# Altium schematic sheet MFG01_01.SchDoc
size A1; SheetNumber: 1; SheetTotal: 1
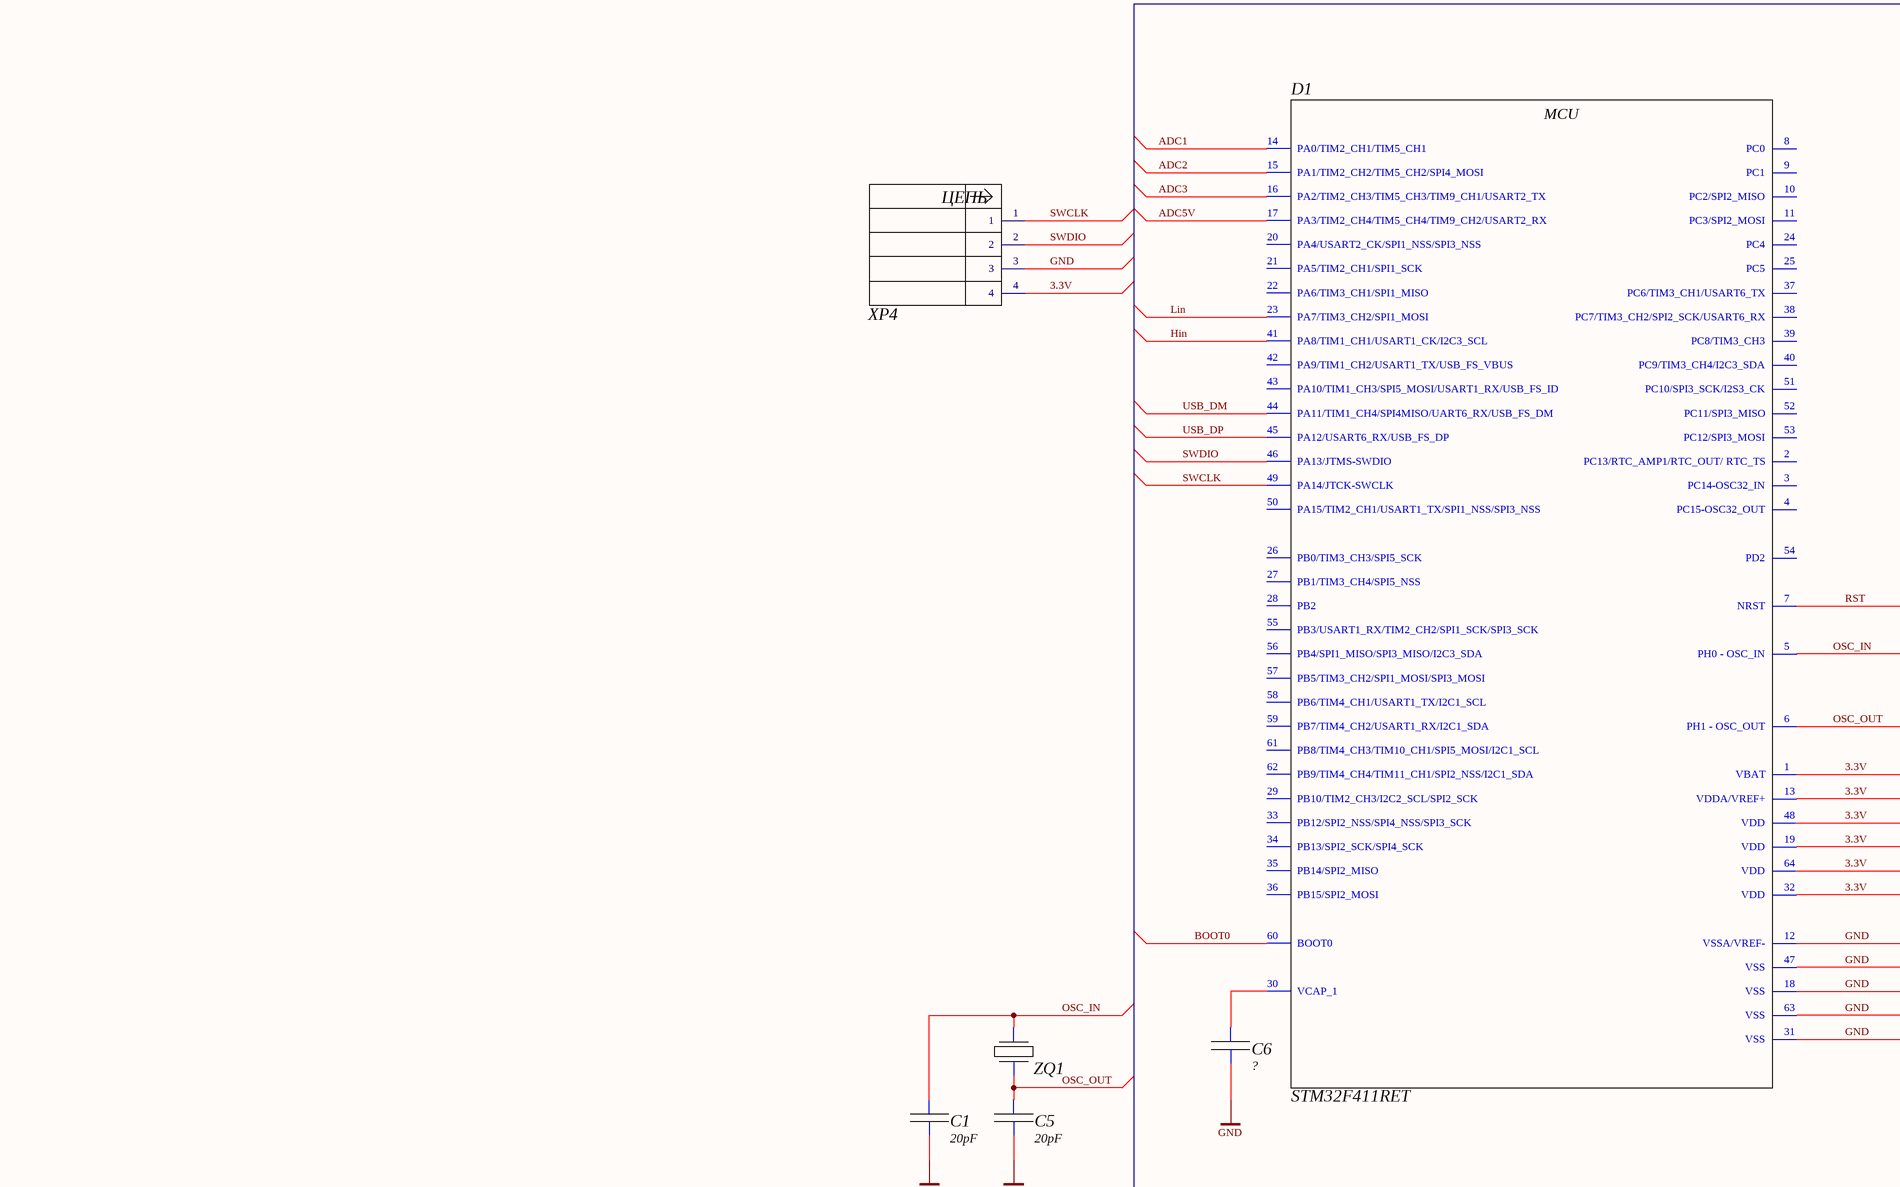
[diagram p0: MFG01_01.SchDoc, top left]
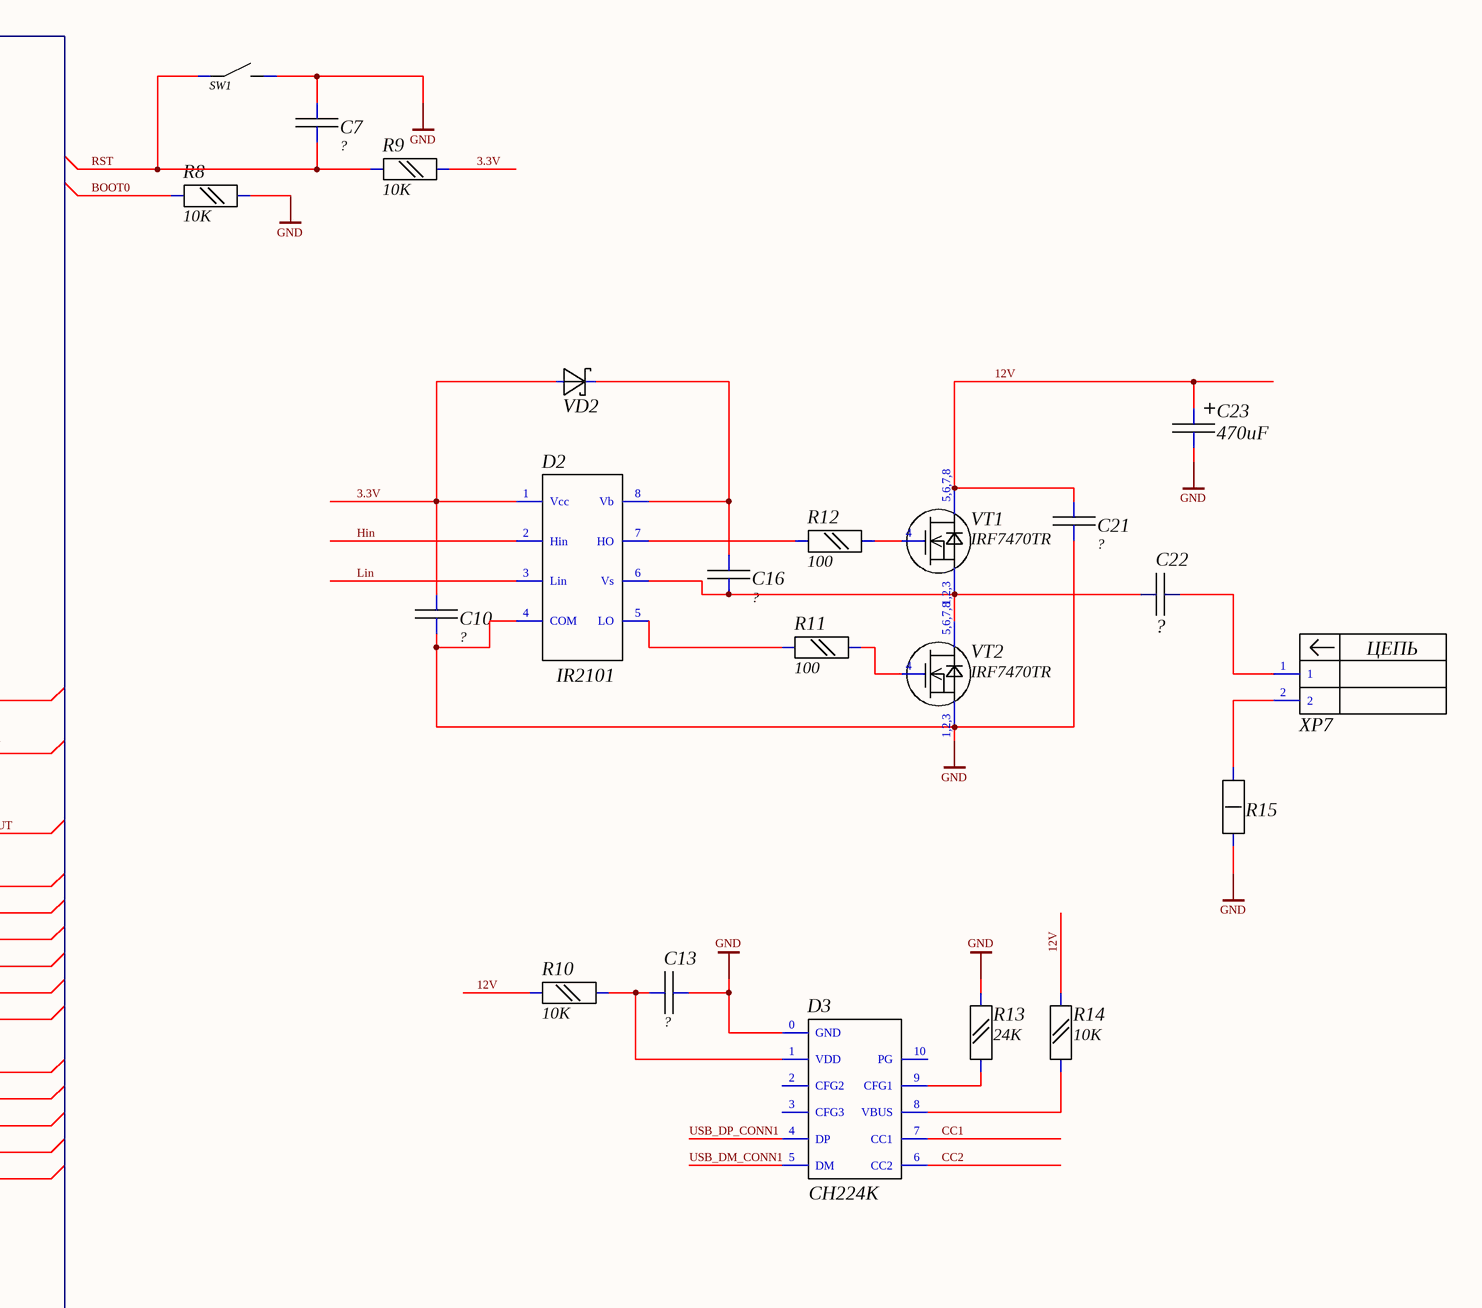
[diagram p1: MFG01_01.SchDoc, top right]
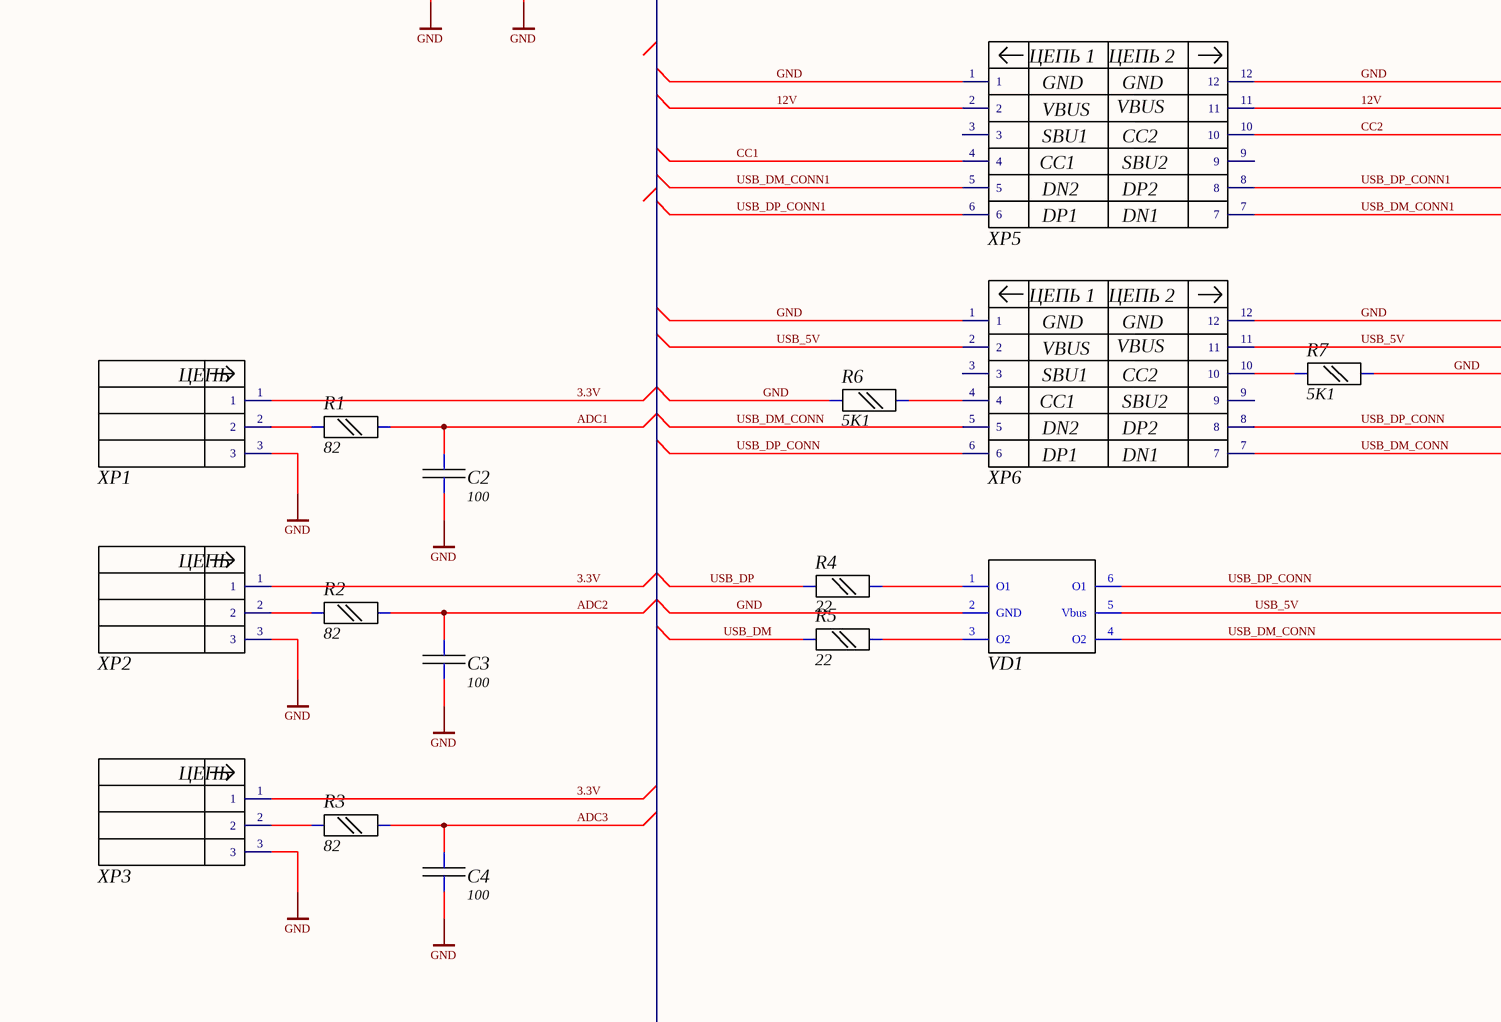
[diagram p2: MFG01_01.SchDoc, bottom left]
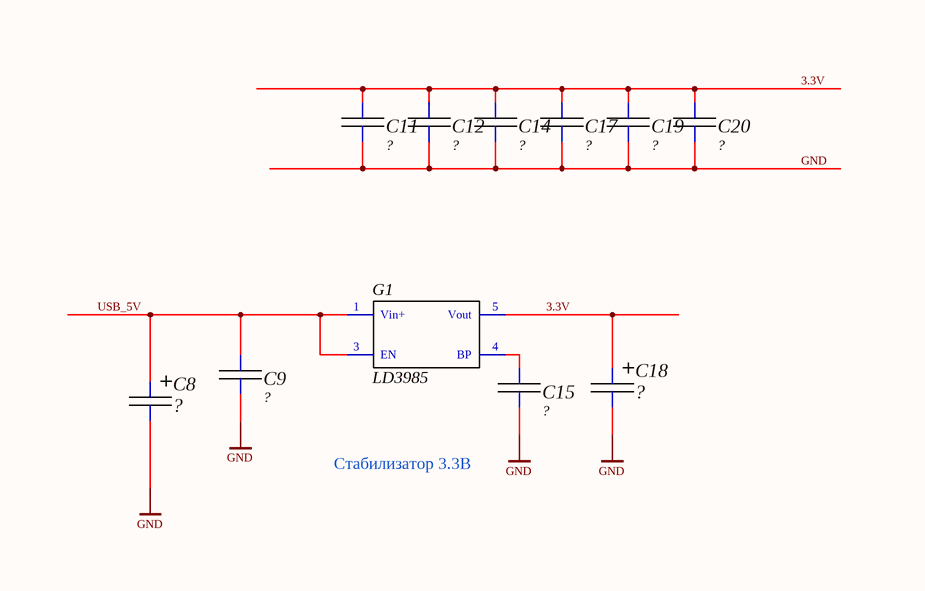
[diagram p3: MFG01_01.SchDoc, bottom right]

## Parts
C1  20pF  [C_0805]
C2  100  [C_0805]
C3  100  [C_0805]
C4  100  [C_0805]
C5  20pF  [C_0805]
C6  ?  [C_0805]
C7  ?  [C_0805]
C8  ?  [Tantalum B]
C9  ?  [C_0805]
C10  ?  [C_0805]
C11  ?  [C_0805]
C12  ?  [C_0805]
C13  ?  [C_0805]
C14  ?  [C_0805]
C15  ?  [C_0805]
C16  ?  [C_0805]
C17  ?  [C_0805]
C18  ?  [Tantalum B]
C19  ?  [C_0805]
C20  ?  [C_0805]
C21  ?  [C_0805]
C22  ?  [CBB104]
C23  470uF  [CAPAE1030X1020N]
D1  STM32F411RET  [LQFP64]
D2  IR2101  [SOIC8]
D3  CH224K  [SOIC10]
G1  LD3985  [SOT95P280X100-5N]
R1  82  [R_0805]
R2  82  [R_0805]
R3  82  [R_0805]
R4  22  [R_0805]
R5  22  [R_0805]
R6  5K1  [R_0805]
R7  5K1  [R_0805]
R8  10K  [R_0805]
R9  10K  [R_0805]
R10  10K  [R_0805]
R11  100  [R_0805]
R12  100  [R_0805]
R13  24K  [R_0805]
R14  10K  [R_0805]
R15  Resistor_1,0W  [RES 1W]  (value not drawn)
SW1  Tact DTS32  [TACT DTS-32]  (value not drawn)
VD1  USBLC6-2SC6  [SSOT-6]  (value not drawn)
VD2  SS14  [DO-214]  (value not drawn)
VT1  IRF7470TR  [SOIC8]
VT2  IRF7470TR  [SOIC8]
XP1  XH3P  [XH3P]  (value not drawn)
XP2  XH3P  [XH3P]  (value not drawn)
XP3  XH3P  [XH3P]  (value not drawn)
XP4  PLS4  [PLS-4]  (value not drawn)
XP5  Type-C  [TYPE-C]  (value not drawn)
XP6  Type-C  [TYPE-C]  (value not drawn)
XP7  EK508_02  [EK508_02]  (value not drawn)
ZQ1  NX5032  [NX5032]  (value not drawn)

## Nets
GND: C1.2 C2.2 C3.2 C4.2 C5.2 C6.2 C7.2 C8.2 C9.2 C10.2 C11.2 C12.2 C13.1 C14.2 C15.2 C17.2 C18.2 C19.2 C20.2 C21.2 C23.2 D1.12(VSSA/VREF-) D1.18(VSS) D1.31(VSS) D1.47(VSS) D1.63(VSS) D2.4(COM) D3.0(GND) G1.2(GND) R6.2 R7.1 R8.1 R13.1 R15.1 SW1.2 VD1.2(GND) VT2.1,2,3(S) XP1.3 XP2.3 XP3.3 XP4.3 XP5.1 XP5.12 XP6.1 XP6.12
3.3V: C10.1 C11.1 C12.1 C14.1 C17.1 C18.1 C19.1 C20.1 D1.1(VBAT) D1.13(VDDA/VREF+) D1.19(VDD) D1.32(VDD) D1.48(VDD) D1.64(VDD) D2.1(Vcc) G1.5(Vout) R9.1 VD2.2(А) XP1.1 XP2.1 XP3.1 XP4.4
12V: C21.1 C23.1 R10.1 R14.1 VT1.5,6,7,8(D) XP5.2 XP5.11
ADC1: C2.1 D1.14(PA0/TIM2_CH1/TIM5_CH1) R1.2
ADC2: C3.1 D1.15(PA1/TIM2_CH2/TIM5_CH2/SPI4_MOSI) R2.2
ADC3: C4.1 D1.16(PA2/TIM2_CH3/TIM5_CH3/TIM9_CH1/USART2_TX) R3.2
ADC5V: D1.17(PA3/TIM2_CH4/TIM5_CH4/TIM9_CH2/USART2_RX)
BOOT0: D1.60(BOOT0) R8.2
CC1: D3.7(CC1) XP5.4
CC2: D3.6(CC2) XP5.10
Hin: D1.41(PA8/TIM1_CH1/USART1_CK/I2C3_SCL) D2.2(Hin)
Lin: D1.23(PA7/TIM3_CH2/SPI1_MOSI) D2.3(Lin)
OSC_IN: C1.1 D1.5(PH0_-_OSC_IN) ZQ1.2
OSC_OUT: C5.1 D1.6(PH1_-_OSC_OUT) ZQ1.1
RST: C7.1 D1.7(NRST) R9.2 SW1.1
SWCLK: D1.49(PA14/JTCK-SWCLK) XP4.1
SWDIO: D1.46(PA13/JTMS-SWDIO) XP4.2
USB_5V: C8.1 C9.1 G1.1(Vin+) G1.3(EN) VD1.5(Vbus) XP6.2 XP6.11
USB_DM: D1.44(PA11/TIM1_CH4/SPI4MISO/UART6_RX/USB_FS_DM) R5.2
USB_DM_CONN: VD1.4(O2) XP6.5 XP6.7
USB_DM_CONN1: D3.5(DM) XP5.5 XP5.7
USB_DP: D1.45(PA12/USART6_RX/USB_FS_DP) R4.2
USB_DP_CONN: VD1.6(O1) XP6.6 XP6.8
USB_DP_CONN1: D3.4(DP) XP5.6 XP5.8
NetC6_1: C6.1 D1.30(VCAP_1)
NetC13_2: C13.2 D3.1(VDD) R10.2
NetC15_1: C15.1 G1.4(BP)
NetC16_1: C16.1 D2.8(Vb) VD2.1(К)
NetC16_2: C16.2 C22.1 D2.6(Vs) VT1.1,2,3(S) VT2.5,6,7,8(D)
NetC22_2: C22.2 XP7.1
NetD2_5: D2.5(LO) R11.2
NetD2_7: D2.7(HO) R12.2
NetD3_8: D3.8(VBUS) R14.2
NetD3_9: D3.9(CFG1) R13.2
NetR1_1: R1.1 XP1.2
NetR2_1: R2.1 XP2.2
NetR3_1: R3.1 XP3.2
NetR4_1: R4.1 VD1.1(O1)
NetR5_1: R5.1 VD1.3(O2)
NetR6_1: R6.1 XP6.4
NetR7_2: R7.2 XP6.10
NetR11_1: R11.1 VT2.4(G)
NetR12_1: R12.1 VT1.4(G)
NetR15_2: R15.2 XP7.2

Not connected (* = marked no-connect by the designer): D1 2(PC13/RTC_AMP1/RTC_OUT/_RTC_TS) 3(PC14-OSC32_IN) 4(PC15-OSC32_OUT) 8(PC0) 9(PC1) 10(PC2/SPI2_MISO) 11(PC3/SPI2_MOSI) 20(PA4/USART2_CK/SPI1_NSS/SPI3_NSS) 21(PA5/TIM2_CH1/SPI1_SCK) 22(PA6/TIM3_CH1/SPI1_MISO) 24(PC4) 25(PC5) 26(PB0/TIM3_CH3/SPI5_SCK) 27(PB1/TIM3_CH4/SPI5_NSS) 28(PB2) 29(PB10/TIM2_CH3/I2C2_SCL/SPI2_SCK) 33(PB12/SPI2_NSS/SPI4_NSS/SPI3_SCK) 34(PB13/SPI2_SCK/SPI4_SCK) 35(PB14/SPI2_MISO) 36(PB15/SPI2_MOSI) 37(PC6/TIM3_CH1/USART6_TX) 38(PC7/TIM3_CH2/SPI2_SCK/USART6_RX) 39(PC8/TIM3_CH3) 40(PC9/TIM3_CH4/I2C3_SDA) 42(PA9/TIM1_CH2/USART1_TX/USB_FS_VBUS) 43(PA10/TIM1_CH3/SPI5_MOSI/USART1_RX/USB_FS_ID) 50(PA15/TIM2_CH1/USART1_TX/SPI1_NSS/SPI3_NSS) 51(PC10/SPI3_SCK/I2S3_CK) 52(PC11/SPI3_MISO) 53(PC12/SPI3_MOSI) 54(PD2) 55(PB3/USART1_RX/TIM2_CH2/SPI1_SCK/SPI3_SCK) 56(PB4/SPI1_MISO/SPI3_MISO/I2C3_SDA) 57(PB5/TIM3_CH2/SPI1_MOSI/SPI3_MOSI) 58(PB6/TIM4_CH1/USART1_TX/I2C1_SCL) 59(PB7/TIM4_CH2/USART1_RX/I2C1_SDA) 61(PB8/TIM4_CH3/TIM10_CH1/SPI5_MOSI/I2C1_SCL) 62(PB9/TIM4_CH4/TIM11_CH1/SPI2_NSS/I2C1_SDA); D3 2(CFG2) 3(CFG3) 10(PG); XP5 3 9; XP6 3 9

## Notes on the sheet
- Стабилизатор 3.3В
- (in symbol EK508_02) ЦЕПЬ
- (in symbol PLS4) ЦЕПЬ
- (in symbol STM32F411RET) MCU
- (in symbol Type-C) ЦЕПЬ 1; ЦЕПЬ 2; GND; VBUS; SBU1; CC2; CC1; SBU2; DN2; DP2; DP1; DN1
- (in symbol XH3P) ЦЕПЬ

## Library data of the parts
C1-C7 C9-C17 C19-C21 = CAP 0805
C8 C18 = Tantalum B
C22 = CBB224: Film capacitor CBB224
C23 = El. Cap. D=10mm: Aluminum Electrolytic Capacitor D=10mm
D1 = STM32F411RET: Performance line, ARM-based 32-bit MCU
D2 = IR2101: Half-Bridge, not invert
D3 = CH224K: supports  PD3.0/2.0,  BC1.2  and  other  boost  fast  charging  protocols
G1 = LD3985: Ultra low drop and low noise BiCMOS voltage regulator
R1-R14 = Resistor SMD 0805
VD1 = USBLC6-2SC6: Very low capacitance ESD protection
VD2 = SS14: Schottky Barrier Rectifier
VT1 VT2 = IRF7470TR: N-MOSFET 40В 10А 2.5Вт
XP1-XP3 = XH3P: PLS3
ZQ1 = NX5032: Resonator SMD
R15 = Resistor_1,0W: Published: 19.09.2014; Publisher: Andrew Danich; Type: Резистор